# Altium project MP3_Player.PrjPcb
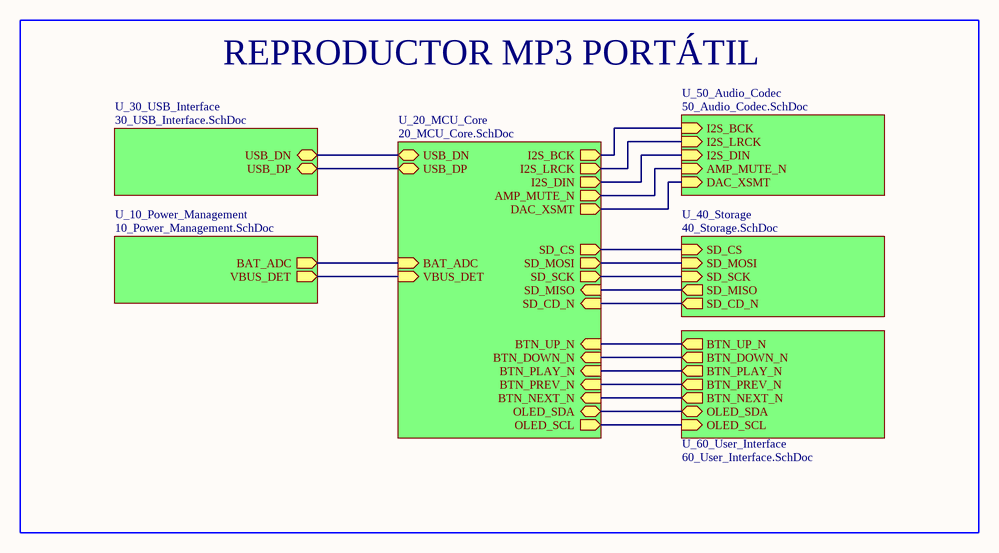
[diagram p0: 00_System_Top.SchDoc]
7 sheets, 93 parts. Net scope: hierarchical (ports join the sheet entries above them; power ports are global).
Board file: MP3_Player.PcbDoc
Sheets:
  00_System_Top.SchDoc
    U_10_Power_Management = 10_Power_Management.SchDoc
    U_60_User_Interface = 60_User_Interface.SchDoc
    U_20_MCU_Core = 20_MCU_Core.SchDoc
    U_30_USB_Interface = 30_USB_Interface.SchDoc
    U_40_Storage = 40_Storage.SchDoc
    U_50_Audio_Codec = 50_Audio_Codec.SchDoc

## Sheet 00_System_Top.SchDoc: Diagrama de bloques
size A4; DrawnBy: Mateo Cárdenas; Revision: Rev A; SheetNumber: 1; SheetTotal: 7

### Sub-sheets
U_10_Power_Management = 10_Power_Management.SchDoc: BAT_ADC (out), VBUS_DET (out)
U_20_MCU_Core = 20_MCU_Core.SchDoc: USB_DN (bidir), USB_DP (bidir), I2S_BCK (out), I2S_LRCK (out), I2S_DIN (out), AMP_MUTE_N (out), DAC_XSMT (out), SD_MOSI (out), SD_SCK (out), SD_MISO (in), SD_CD_N (in), SD_CS (out), OLED_SCL (out), OLED_SDA (bidir), BTN_NEXT_N (in), BTN_PREV_N (in), BTN_PLAY_N (in), BTN_DOWN_N (in), BTN_UP_N (in), VBUS_DET (in), BAT_ADC (in)
U_30_USB_Interface = 30_USB_Interface.SchDoc: USB_DN (bidir), USB_DP (bidir)
U_40_Storage = 40_Storage.SchDoc: SD_CS (in), SD_MOSI (in), SD_SCK (in), SD_MISO (out), SD_CD_N (out)
U_50_Audio_Codec = 50_Audio_Codec.SchDoc: I2S_BCK (in), I2S_LRCK (in), I2S_DIN (in), DAC_XSMT (in), AMP_MUTE_N (in)
U_60_User_Interface = 60_User_Interface.SchDoc: BTN_UP_N (out), BTN_DOWN_N (out), BTN_PLAY_N (out), BTN_PREV_N (out), BTN_NEXT_N (out), OLED_SDA (bidir), OLED_SCL (in)

### Nets
AMP_MUTE_N: sheet U_20_MCU_Core/AMP_MUTE_N, sheet U_50_Audio_Codec/AMP_MUTE_N
BAT_ADC: sheet U_10_Power_Management/BAT_ADC, sheet U_20_MCU_Core/BAT_ADC
BTN_DOWN_N: sheet U_60_User_Interface/BTN_DOWN_N, sheet U_20_MCU_Core/BTN_DOWN_N
BTN_NEXT_N: sheet U_60_User_Interface/BTN_NEXT_N, sheet U_20_MCU_Core/BTN_NEXT_N
BTN_PLAY_N: sheet U_60_User_Interface/BTN_PLAY_N, sheet U_20_MCU_Core/BTN_PLAY_N
BTN_PREV_N: sheet U_60_User_Interface/BTN_PREV_N, sheet U_20_MCU_Core/BTN_PREV_N
BTN_UP_N: sheet U_60_User_Interface/BTN_UP_N, sheet U_20_MCU_Core/BTN_UP_N
DAC_XSMT: sheet U_20_MCU_Core/DAC_XSMT, sheet U_50_Audio_Codec/DAC_XSMT
I2S_BCK: sheet U_20_MCU_Core/I2S_BCK, sheet U_50_Audio_Codec/I2S_BCK
I2S_DIN: sheet U_20_MCU_Core/I2S_DIN, sheet U_50_Audio_Codec/I2S_DIN
I2S_LRCK: sheet U_20_MCU_Core/I2S_LRCK, sheet U_50_Audio_Codec/I2S_LRCK
OLED_SCL: sheet U_60_User_Interface/OLED_SCL, sheet U_20_MCU_Core/OLED_SCL
OLED_SDA: sheet U_60_User_Interface/OLED_SDA, sheet U_20_MCU_Core/OLED_SDA
SD_CD_N: sheet U_20_MCU_Core/SD_CD_N, sheet U_40_Storage/SD_CD_N
SD_CS: sheet U_20_MCU_Core/SD_CS, sheet U_40_Storage/SD_CS
SD_MISO: sheet U_20_MCU_Core/SD_MISO, sheet U_40_Storage/SD_MISO
SD_MOSI: sheet U_20_MCU_Core/SD_MOSI, sheet U_40_Storage/SD_MOSI
SD_SCK: sheet U_20_MCU_Core/SD_SCK, sheet U_40_Storage/SD_SCK
USB_DN: sheet U_20_MCU_Core/USB_DN, sheet U_30_USB_Interface/USB_DN
USB_DP: sheet U_20_MCU_Core/USB_DP, sheet U_30_USB_Interface/USB_DP
VBUS_DET: sheet U_10_Power_Management/VBUS_DET, sheet U_20_MCU_Core/VBUS_DET

### Notes on the sheet
- REPRODUCTOR MP3 PORTÁTIL

## Sheet 10_Power_Management.SchDoc: Gestión de energía
size A4; DrawnBy: Mateo Cárdenas; Revision: Rev A; SheetNumber: 2; SheetTotal: 7
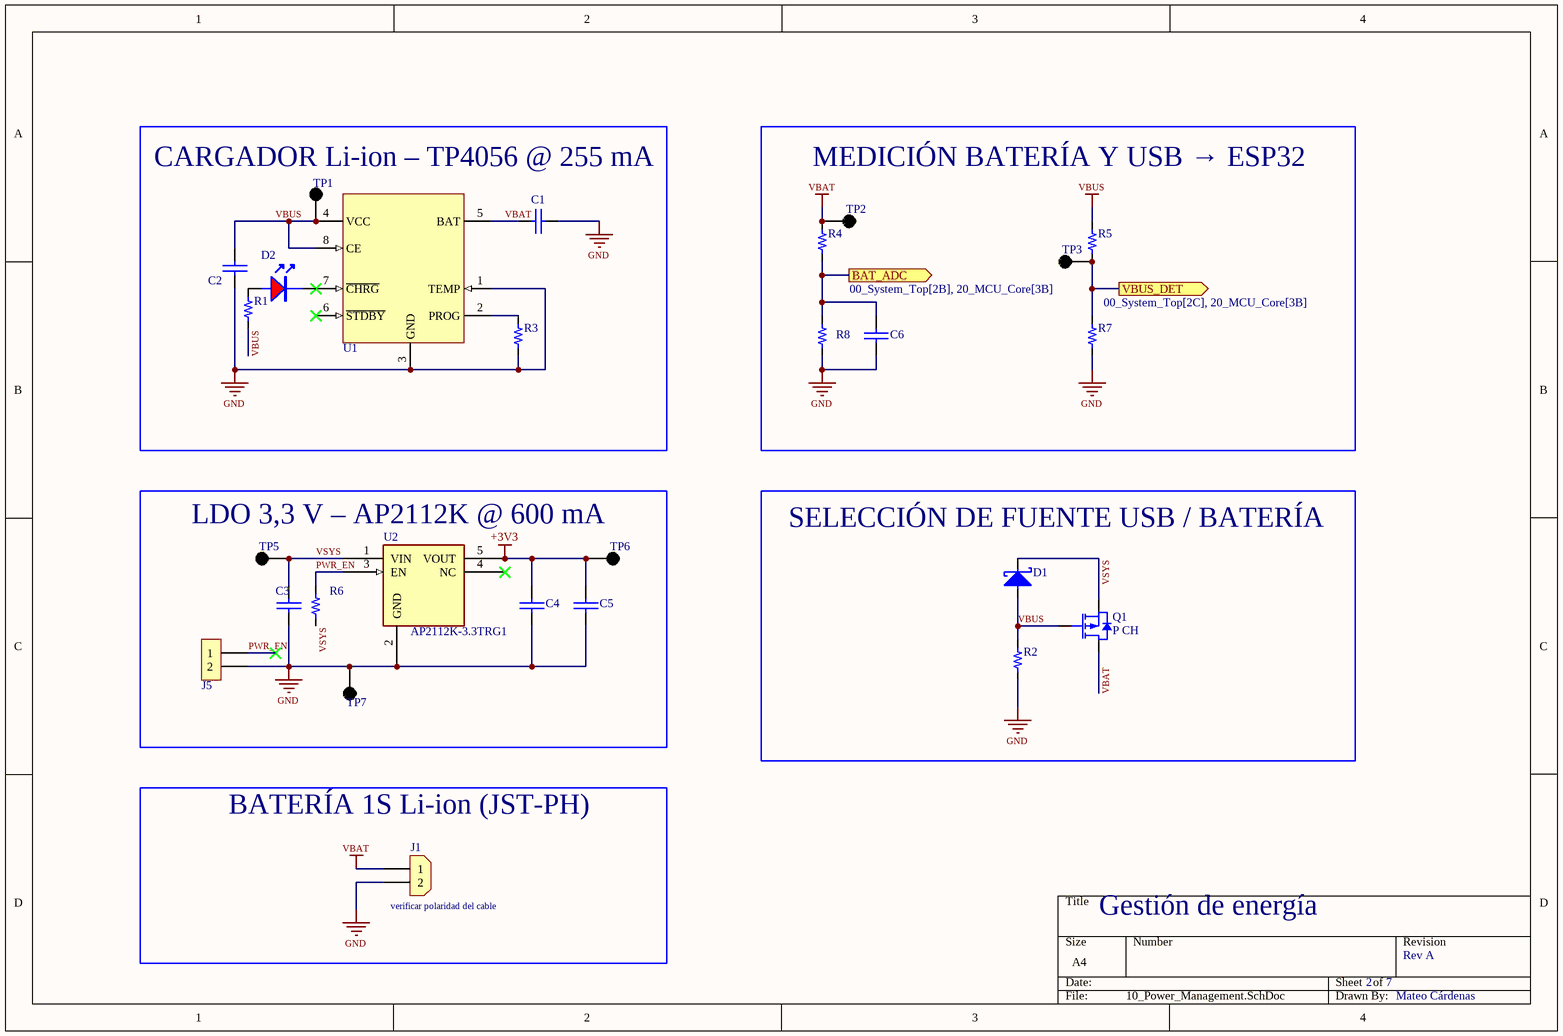
[diagram p1: 10_Power_Management.SchDoc]

### Parts
C1  10uF 10V  [0603_cap]  (value not drawn)
C2  10uF 10V  [0603_cap]  (value not drawn)
C3  10uF 10V  [0603_cap]  (value not drawn)
C4  10uF 10V  [0603_cap]  (value not drawn)
C5  0.1uF 50V  [0603_cap]  (value not drawn)
C6  0.1uF 50V  [0603_cap]  (value not drawn)
D1  40V 1A  [SOD_123]  (value not drawn)
D2  2V  [0805_LED]  (value not drawn)
J1  Connector 2pos  [CON_2x1_TH_2MM]  (value not drawn)
J5  2x1  [H_2x1_TH_100mil]  (value not drawn)  (no BOM)
Q1  P CH  [SOT_23_3]
R1  1k 1/10W  [0603_res]  (value not drawn)
R2  49k9 1/10W  [0603_res]  (value not drawn)
R3  4k7 1/10W  [0603_res]  (value not drawn)
R4  390k 1/10W  [0603_res]  (value not drawn)
R5  390k 1/10W  [0603_res]  (value not drawn)
R6  10k 1/10W  [0603_res]  (value not drawn)
R7  390k 1/10W  [0603_res]  (value not drawn)
R8  390k 1/10W  [0603_res]  (value not drawn)
TP1  Test Point  [Test Point]  (value not drawn)
TP2  Test Point  [Test Point]  (value not drawn)
TP3  Test Point  [Test Point]  (value not drawn)
TP5  Test Point  [Test Point]  (value not drawn)
TP6  Test Point  [Test Point]  (value not drawn)
TP7  Test Point  [Test Point]  (value not drawn)
U1  4.2V 1A  [SOIC_8_3.9mm]  (value not drawn)
U2  AP2112K-3.3TRG1  [SOT-23-5]

### Blocks framed on the sheet
CARGADOR Li-ion – TP4056 @ 255 mA: C1 C2 D2 R1 R3 TP1 U1
MEDICIÓN BATERÍA Y USB → ESP32: C6 R4 R5 R7 R8 TP2 TP3
LDO 3,3 V – AP2112K @ 600 mA: C3-C5 J5 R6 TP5-TP7 U2
SELECCIÓN DE FUENTE USB / BATERÍA: D1 Q1 R2
BATERÍA 1S Li-ion (JST-PH): J1

### Ports
BAT_ADC (out, see 00_System_Top[2B], 20_MCU_Core[3B]), VBUS_DET (out, see 00_System_Top[2C], 20_MCU_Core[3B])

### Nets
+3V3: C4.1 C5.1 TP6.1(TP?) U2.5(VOUT)
GND: C1.1 C2.2 C3.2 C4.2 C5.2 C6.1 J1.2 J5.2 R2.1 R3.1 R7.2 R8.1 TP7.1(TP?) U1.1(TEMP) U1.3(GND) U2.2(GND)
VBAT: C1.2 J1.1 Q1.3(D) R4.2 TP2.1(TP?) U1.5(BAT)
VBUS: C2.1 D1.2 Q1.1(G) R1.2 R2.2 R5.1 TP1.1(TP?) U1.4(VCC) U1.8(CE)
BAT_ADC: C6.2 R4.1 R8.2 ; port BAT_ADC
PWR_EN: J5.1 R6.2 U2.3(EN)
VBUS_DET: R5.2 R7.1 TP3.1(TP?) ; port VBUS_DET
VSYS: C3.1 D1.1 Q1.2(S) R6.1 TP5.1(TP?) U2.1(VIN)
NetD2_1: D2.1(A) R1.1
NetD2_2: D2.2 U1.7(~{CHRG})
NetR3_2: R3.2 U1.2(PROG)

Not connected (* = marked no-connect by the designer): U1 6(~{STDBY})*; U2 4(NC)*

### Notes on the sheet
- (near J1) verificar polaridad del cable

### Library data of the parts
C1-C4 = Cap_10uF_0603_10V: 10V 10uF X5R ±10% 0603 Multilayer Ceramic Capacitors MLCC - SMD/SMT ROHS; Manufacturer: CCTC; Manufacturer Part Number: TCC0603X5R106K100CT; Supplier 1: LCSC; Supplier Part Number 1: C380314; ComponentLink1Description: LCSC; ComponentLink1URL: https://www.lcsc.com/product-detail/Multilayer-Ceramic-Capacitors-MLCC-SMD-SMT_CCTC-TCC0603X5R106K100CT_C380314.html; Value: 10uF
C5 C6 = Cap_0.1uF_0603_50V: 50V 100nF Y5V -20%~+80% 0603 Multilayer Ceramic Capacitors MLCC - SMD/SMT ROHS; Manufacturer: Walsin Tech Corp; Manufacturer Part Number: 0603F104Z500CT; Supplier 1: LCSC; Supplier Part Number 1: C83060; ComponentLink1Description: LCSC; ComponentLink1URL: https://www.lcsc.com/product-detail/Multilayer-Ceramic-Capacitors-MLCC-SMD-SMT_Walsin-Tech-Corp-0603F104Z500CT_C83060.html; Value: 0.1uF
D1 = D_Schottky_40V_1A_SOD_123F: DIODE SCHOTTKY 40V 1A SOD123F; Manufacturer: Shanghai Prisemi Elec; Manufacturer Part Number: PSBD1DF40V1H; Supplier 1: LCSC; Supplier Part Number 1: C110730; ComponentLink1Description: LCSC; ComponentLink1URL: https://www.lcsc.com/product-detail/Switching-Diode_Shanghai-Prisemi-Elec-PSBD1DF40V1H_C110730.html
D2 = LED_0805_RED: LED RED CLEAR 0805 SMD; Manufacturer: XINGLIGHT; Manufacturer Part Number: XL-2012SURC; Supplier 1: LCSC; Supplier Part Number 1: C965812; ComponentLink1Description: LCSC; ComponentLink1URL: https://www.lcsc.com/product-detail/Light-Emitting-Diodes-LED_XINGLIGHT-XL-2012SURC_C965812.html
J1 = Con_2x1_TH_JST_2MM: 2POS 2MM; Manufacturer: JST; Manufacturer Part Number: S2B-PH-K-S(LF)(SN); Supplier 1: LCSC; Supplier Part Number 1: C173752; ComponentLink1Description: Digi-Key; ComponentLink1URL: https://lcsc.com/product-detail/Wire-To-Board-Connector_JST-S2B-PH-K-S-LF-SN_C173752.html
J5 = H_Male_2x1_TH_100mil: ComponentLink1Description: LCSC
Q1 = Q_PFET_30V_3A_SOT23: MOSFET P-CH 20V 3A SOT23; Manufacturer: ALLPOWER(ShenZhen Quan Li Semiconductor); Manufacturer Part Number: AP2301; Supplier 1: LCSC; Supplier Part Number 1: C385296; ComponentLink1Description: LCSC; ComponentLink1URL: https://www.lcsc.com/product-detail/MOSFETs_ALLPOWER-ShenZhen-Quan-Li-Semiconductor-AP2301_C385296.html
R1 = Res_1k_0603_1/10W: RES SMD 1k OHM 5% 1/10W 0603; Manufacturer: FOJAN; Manufacturer Part Number: FRC0603J102 TS; ComponentLink1URL: https://www.lcsc.com/product-detail/Chip-Resistor-Surface-Mount_FOJAN-FRC0603J102-TS_C2907113.html; Supplier 1: LCSC; Supplier Part Number 1: C2907113; ComponentLink1Description: LCSC; Value: 1k
R2 = Res_49k9_0603_1/10W: 100mW Thick Film Resistor 75V ±100ppm/℃ ±1% 49.9kΩ 0603 Chip Resistor - Surface Mount ROHS; Manufacturer: YAGEO; Manufacturer Part Number: RC0603FR-0749K9L; ComponentLink1URL: https://lcsc.com/product-detail/Chip-Resistor-Surface-Mount_YAGEO-RC0603FR-0749K9L_C114624.html; Supplier 1: LCSC; Supplier Part Number 1: C114624; ComponentLink1Description: LCSC; Value: 49k9
R3 = Res_4k7_0603_1/10W: 100mW Thick Film Resistor 75V ±1% 4.7kΩ 0603 Chip Resistor - Surface Mount ROHS; Manufacturer: VO; Manufacturer Part Number: SCR0603F4K7; ComponentLink1URL: https://lcsc.com/product-detail/Chip-Resistor-Surface-Mount_VO-SCR0603F4K7_C3016318.html; Supplier 1: LCSC; Supplier Part Number 1: C3016318; ComponentLink1Description: LCSC; Value: 4k7
R4 R5 R7 R8 = Res_390k_0603_1/10W: 100mW Thick Film Resistor 75V ±100ppm/℃ ±1% 390kΩ 0603 Chip Resistor - Surface Mount ROHS; Manufacturer: YAGEO; Manufacturer Part Number: RC0603FR-07390KL; ComponentLink1URL: https://lcsc.com/product-detail/Chip-Resistor-Surface-Mount_YAGEO-RC0603FR-07390KL_C137735.html; Supplier 1: LCSC; Supplier Part Number 1: C137735; ComponentLink1Description: LCSC; Value: 390k
R6 = Res_10k_0603_1/10W: RES SMD 10k OHM 5% 1/10W 0603; Manufacturer: FOJAN; Manufacturer Part Number: FRC0603J103TS; ComponentLink1URL: https://www.lcsc.com/product-detail/Chip-Resistor-Surface-Mount_FOJAN-FRC0603J103TS_C2930027.html; Supplier 1: LCSC; Supplier Part Number 1: C2930027; ComponentLink1Description: LCSC; Value: 10k
TP1-TP3 TP5-TP7 = Test Point: PC TEST POINT; Manufacturer: KOA Speer Electronics, Inc.; Manufacturer Part Number: RCWCTE
U1 = IC_BAT_CHG_4.2V_1A: -300mV~8V Lithium-ion/Polymer 1 1A ESOP-8 Battery Management ROHS; Manufacturer: YONGYUTAI; Manufacturer Part Number: TP4056; Supplier 1: LCSC; Supplier Part Number 1: C20199357; ComponentLink1Description: LCSC; ComponentLink1URL: https://lcsc.com/product-detail/Battery-Management_YONGYUTAI-TP4056_C20199357.html
U2 = AP2112K-3.3TRG1: Diodes AP2112 600 mA low-dropout 3.3 V regulator, SOT-23-5 (SOT25). EN high = on.; Manufacturer: Diodes Incorporated; Verification: Pinout and land pattern from datasheet; not yet built or tested; Manufacturer Part Number: AP2112K-3.3TRG1; Datasheet: DS39724 Rev. 2-2 (June 2017)

## Sheet 60_User_Interface.SchDoc: Interfaz de usuario
size A4; DrawnBy: Mateo Cárdenas; Revision: Rev A; SheetNumber: 7; SheetTotal: 7
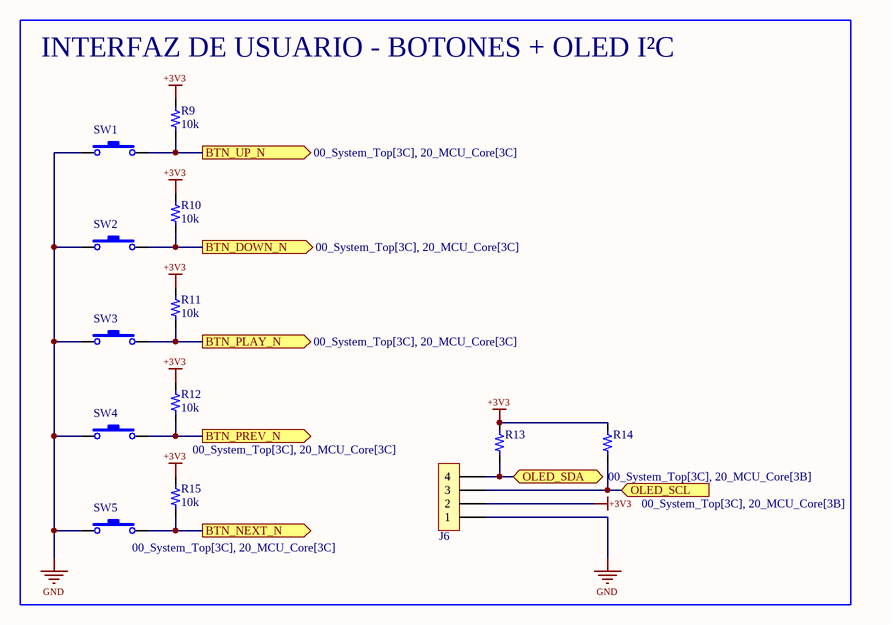
[diagram p2: 60_User_Interface.SchDoc]

### Parts
J6  4x1  [H_4x1_TH_2.54mm]  (value not drawn)  (no BOM)
R9  value 10k  [0603_res]  (hidden comment: 10k 1/10W)
R10  value 10k  [0603_res]  (hidden comment: 10k 1/10W)
R11  value 10k  [0603_res]  (hidden comment: 10k 1/10W)
R12  value 10k  [0603_res]  (hidden comment: 10k 1/10W)
R13  4k7 1/10W  [0603_res]  (value not drawn)
R14  4k7 1/10W  [0603_res]  (value not drawn)
R15  value 10k  [0603_res]  (hidden comment: 10k 1/10W)
SW1  Sw  [Sw_PUSH_4.5x4.5x5mm]  (value not drawn)
SW2  Sw  [Sw_PUSH_4.5x4.5x5mm]  (value not drawn)
SW3  Sw  [Sw_PUSH_4.5x4.5x5mm]  (value not drawn)
SW4  Sw  [Sw_PUSH_4.5x4.5x5mm]  (value not drawn)
SW5  Sw  [Sw_PUSH_4.5x4.5x5mm]  (value not drawn)

### Blocks framed on the sheet
INTERFAZ DE USUARIO - BOTONES + OLED I²C: J6 R9-R15 SW1-SW5

### Ports
BTN_DOWN_N (out, see 00_System_Top[3C], 20_MCU_Core[3C]), BTN_NEXT_N (out, see 00_System_Top[3C], 20_MCU_Core[3C]), BTN_PLAY_N (out, see 00_System_Top[3C], 20_MCU_Core[3C]), BTN_PREV_N (out, see 00_System_Top[3C], 20_MCU_Core[3C]), BTN_UP_N (out, see 00_System_Top[3C], 20_MCU_Core[3C]), OLED_SCL (in, see 00_System_Top[3C], 20_MCU_Core[3B]), OLED_SDA (bidir, see 00_System_Top[3C], 20_MCU_Core[3B])

### Nets
+3V3: J6.2 R9.1 R10.2 R11.2 R12.1 R13.2 R14.2 R15.1
GND: J6.1 SW1.1 SW2.1 SW3.1 SW4.1 SW5.1
BTN_DOWN_N: R10.1 SW2.2 ; port BTN_DOWN_N
BTN_NEXT_N: R15.2 SW5.2 ; port BTN_NEXT_N
BTN_PLAY_N: R11.1 SW3.2 ; port BTN_PLAY_N
BTN_PREV_N: R12.2 SW4.2 ; port BTN_PREV_N
BTN_UP_N: R9.2 SW1.2 ; port BTN_UP_N
OLED_SCL: J6.3 R14.1 ; port OLED_SCL
OLED_SDA: J6.4 R13.1 ; port OLED_SDA

### Library data of the parts
J6 = H_Male_4x1_TH_100mil: ComponentLink1Description: LCSC
R9-R12 R15 = Res_10k_0603_1/10W: as R6 on sheet 10_Power_Management; ComponentLink1URL: https://www.lcsc.com/product-detail/Chip-Resistor-Surface-Mount_FOJAN-FRC0603J103TS_C2930027.html; Supplier 1: LCSC; Supplier Part Number 1: C2930027; ComponentLink1Description: LCSC
R13 R14 = Res_4k7_0603_1/10W: as R3 on sheet 10_Power_Management; ComponentLink1URL: https://lcsc.com/product-detail/Chip-Resistor-Surface-Mount_VO-SCR0603F4K7_C3016318.html; Supplier 1: LCSC; Supplier Part Number 1: C3016318; ComponentLink1Description: LCSC; Value: 4k7
SW1-SW5 = Sw_PUSH_4.5x4.5x5.0xmm: SWITCH TACTILE SPST-NO 0.05A 12V; Manufacturer: BZCN; Manufacturer Part Number: TSC015A05026A; Supplier 1: LCSC; Supplier Part Number 1: C2888509; Last modified by: N-A.Potosi; Last modified date: 20190222; ComponentLink1Description: LCSC; ComponentLink1URL: https://www.lcsc.com/product-detail/Tactile-Switches_BZCN-TSC015A05026A_C2888509.html

## Sheet 20_MCU_Core.SchDoc: Microcontrolador
size A4; DrawnBy: Mateo Cárdenas; Revision: Rev A; SheetNumber: 3; SheetTotal: 7
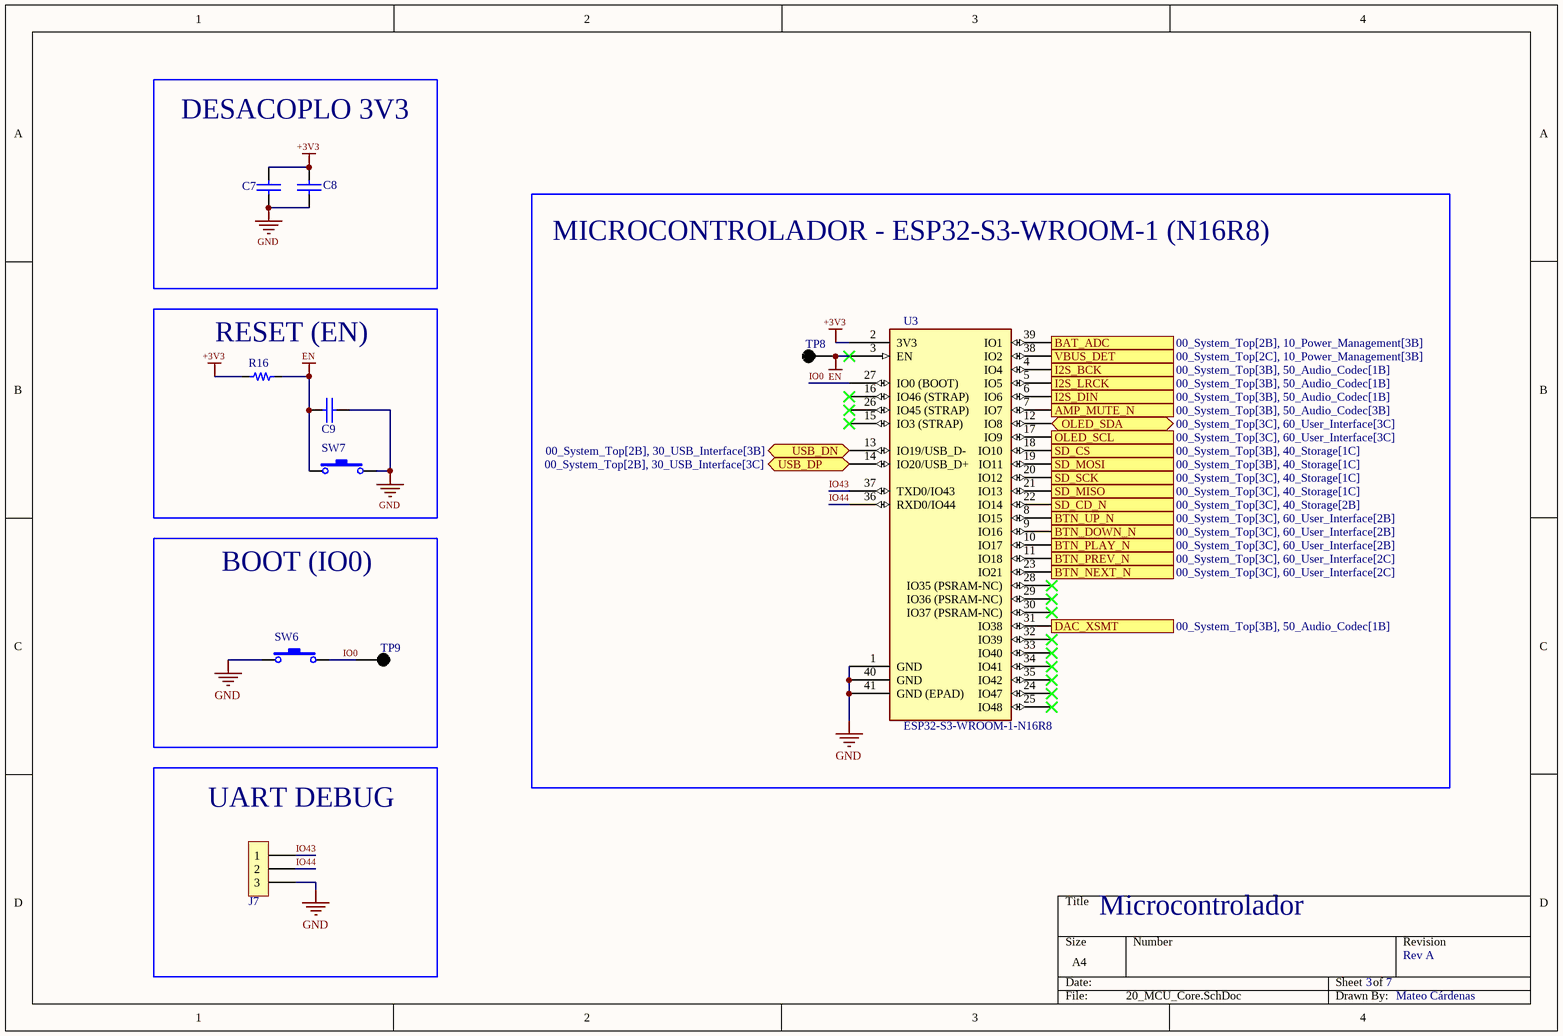
[diagram p3: 20_MCU_Core.SchDoc]

### Parts
C7  0.1uF 50V  [0603_cap]  (value not drawn)
C8  10uF 10V  [0603_cap]  (value not drawn)
C9  1uF 50V  [0603_cap]  (value not drawn)
J7  3x1  [H_3X1_TH_100mil]  (value not drawn)  (no BOM)
R16  10k 1/10W  [0603_res]  (value not drawn)
SW6  Sw  [Sw_PUSH_4.5x4.5x5mm]  (value not drawn)
SW7  Sw  [Sw_PUSH_4.5x4.5x5mm]  (value not drawn)
TP8  Test Point  [Test Point]  (value not drawn)
TP9  Test Point  [Test Point]  (value not drawn)
U3  ESP32-S3-WROOM-1-N16R8  [ESP32-S3-WROOM-1]

### Blocks framed on the sheet
DESACOPLO 3V3: C7 C8
MICROCONTROLADOR - ESP32-S3-WROOM-1 (N16R8): TP8 U3
RESET (EN): C9 R16 SW7
BOOT (IO0): SW6 TP9
UART DEBUG: J7

### Ports
AMP_MUTE_N (out, see 00_System_Top[3B], 50_Audio_Codec[3B]), BAT_ADC (in, see 00_System_Top[2B], 10_Power_Management[3B]), BTN_DOWN_N (in, see 00_System_Top[3C], 60_User_Interface[2B]), BTN_NEXT_N (in, see 00_System_Top[3C], 60_User_Interface[2C]), BTN_PLAY_N (in, see 00_System_Top[3C], 60_User_Interface[2B]), BTN_PREV_N (in, see 00_System_Top[3C], 60_User_Interface[2C]), BTN_UP_N (in, see 00_System_Top[3C], 60_User_Interface[2B]), DAC_XSMT (out, see 00_System_Top[3B], 50_Audio_Codec[1B]), I2S_BCK (out, see 00_System_Top[3B], 50_Audio_Codec[1B]), I2S_DIN (out, see 00_System_Top[3B], 50_Audio_Codec[1B]), I2S_LRCK (out, see 00_System_Top[3B], 50_Audio_Codec[1B]), OLED_SCL (out, see 00_System_Top[3C], 60_User_Interface[3C]), OLED_SDA (bidir, see 00_System_Top[3C], 60_User_Interface[3C]), SD_CD_N (in, see 00_System_Top[3C], 40_Storage[2B]), SD_CS (out, see 00_System_Top[3B], 40_Storage[1C]), SD_MISO (in, see 00_System_Top[3C], 40_Storage[1C]), SD_MOSI (out, see 00_System_Top[3B], 40_Storage[1C]), SD_SCK (out, see 00_System_Top[3C], 40_Storage[1C]), USB_DN (bidir, see 00_System_Top[2B], 30_USB_Interface[3B]), USB_DP (bidir, see 00_System_Top[2B], 30_USB_Interface[3C]), VBUS_DET (in, see 00_System_Top[2C], 10_Power_Management[3B])

### Nets
+3V3: C7.1 C8.1 R16.1 U3.2(3V3)
EN: C9.1 R16.2 SW7.1 TP8.1(TP?) U3.3(EN)
GND: C7.2 C8.2 C9.2 J7.3 SW6.1 SW7.2 U3.1(GND) U3.40(GND) U3.41(GND_(EPAD))
AMP_MUTE_N: U3.7(IO7) ; port AMP_MUTE_N
BAT_ADC: U3.39(IO1) ; port BAT_ADC
BTN_DOWN_N: U3.9(IO16) ; port BTN_DOWN_N
BTN_NEXT_N: U3.23(IO21) ; port BTN_NEXT_N
BTN_PLAY_N: U3.10(IO17) ; port BTN_PLAY_N
BTN_PREV_N: U3.11(IO18) ; port BTN_PREV_N
BTN_UP_N: U3.8(IO15) ; port BTN_UP_N
DAC_XSMT: U3.31(IO38) ; port DAC_XSMT
I2S_BCK: U3.4(IO4) ; port I2S_BCK
I2S_DIN: U3.6(IO6) ; port I2S_DIN
I2S_LRCK: U3.5(IO5) ; port I2S_LRCK
IO0: SW6.2 TP9.1(TP?) U3.27(IO0_(BOOT))
IO43: J7.1 U3.37(TXD0/IO43)
IO44: J7.2 U3.36(RXD0/IO44)
OLED_SCL: U3.17(IO9) ; port OLED_SCL
OLED_SDA: U3.12(IO8) ; port OLED_SDA
SD_CD_N: U3.22(IO14) ; port SD_CD_N
SD_CS: U3.18(IO10) ; port SD_CS
SD_MISO: U3.21(IO13) ; port SD_MISO
SD_MOSI: U3.19(IO11) ; port SD_MOSI
SD_SCK: U3.20(IO12) ; port SD_SCK
USB_DN: U3.13(IO19/USB_D-) ; port USB_DN
USB_DP: U3.14(IO20/USB_D+) ; port USB_DP
VBUS_DET: U3.38(IO2) ; port VBUS_DET

Not connected (* = marked no-connect by the designer): U3 15(IO3_(STRAP))* 16(IO46_(STRAP))* 24(IO47)* 25(IO48)* 26(IO45_(STRAP))* 28(IO35_(PSRAM-NC))* 29(IO36_(PSRAM-NC))* 30(IO37_(PSRAM-NC))* 32(IO39)* 33(IO40)* 34(IO41)* 35(IO42)*

### Library data of the parts
C7 = Cap_0.1uF_0603_50V: as C5 on sheet 10_Power_Management; Supplier 1: LCSC; Supplier Part Number 1: C83060; ComponentLink1Description: LCSC; ComponentLink1URL: https://www.lcsc.com/product-detail/Multilayer-Ceramic-Capacitors-MLCC-SMD-SMT_Walsin-Tech-Corp-0603F104Z500CT_C83060.html; Value: 0.1uF
C8 = Cap_10uF_0603_10V: as C1 on sheet 10_Power_Management; Supplier 1: LCSC; Supplier Part Number 1: C380314; ComponentLink1Description: LCSC; ComponentLink1URL: https://www.lcsc.com/product-detail/Multilayer-Ceramic-Capacitors-MLCC-SMD-SMT_CCTC-TCC0603X5R106K100CT_C380314.html; Value: 10uF
C9 = Cap_1uF_0603_50V: 50V 1uF X5R ±10% 0603 Multilayer Ceramic Capacitors MLCC - SMD/SMT ROHS; Manufacturer: Samsung Electro-Mechanics; Manufacturer Part Number: CL10A105KB8NNNC; Supplier 1: LCSC; Supplier Part Number 1: C15849; ComponentLink1Description: LCSC; ComponentLink1URL: https://www.lcsc.com/product-detail/Multilayer-Ceramic-Capacitors-MLCC-SMD-SMT_Samsung-Electro-Mechanics-CL10A105KB8NNNC_C15849.html; Value: 1uF
J7 = H_Male_3x1_TH_100mil: ComponentLink1Description: LCSC
R16 = Res_10k_0603_1/10W: as R6 on sheet 10_Power_Management; ComponentLink1URL: https://www.lcsc.com/product-detail/Chip-Resistor-Surface-Mount_FOJAN-FRC0603J103TS_C2930027.html; Supplier 1: LCSC; Supplier Part Number 1: C2930027; ComponentLink1Description: LCSC; Value: 10k
SW6 SW7 = Sw_PUSH_4.5x4.5x5.0xmm: as SW1 on sheet 60_User_Interface; Supplier 1: LCSC; Supplier Part Number 1: C2888509; Last modified by: N-A.Potosi; Last modified date: 20190222; ComponentLink1Description: LCSC; ComponentLink1URL: https://www.lcsc.com/product-detail/Tactile-Switches_BZCN-TSC015A05026A_C2888509.html
TP8 TP9 = Test Point: as TP1 on sheet 10_Power_Management
U3 = ESP32-S3-WROOM-1-N16R8: ESP32-S3-WROOM-1 module, 16MB flash, 8MB octal PSRAM. IO35-IO37 are used by the PSRAM: leave unconnected.; Manufacturer: Espressif Systems; Verification: Pinout and land pattern from datasheet; not yet built or tested; Manufacturer Part Number: ESP32-S3-WROOM-1-N16R8; Datasheet: esp32-s3-wroom-1_wroom-1u_datasheet_en.pdf v1.8

## Sheet 30_USB_Interface.SchDoc: Interfaz USB
size A4; DrawnBy: Mateo Cárdenas; Revision: Rev A; SheetNumber: 4; SheetTotal: 7
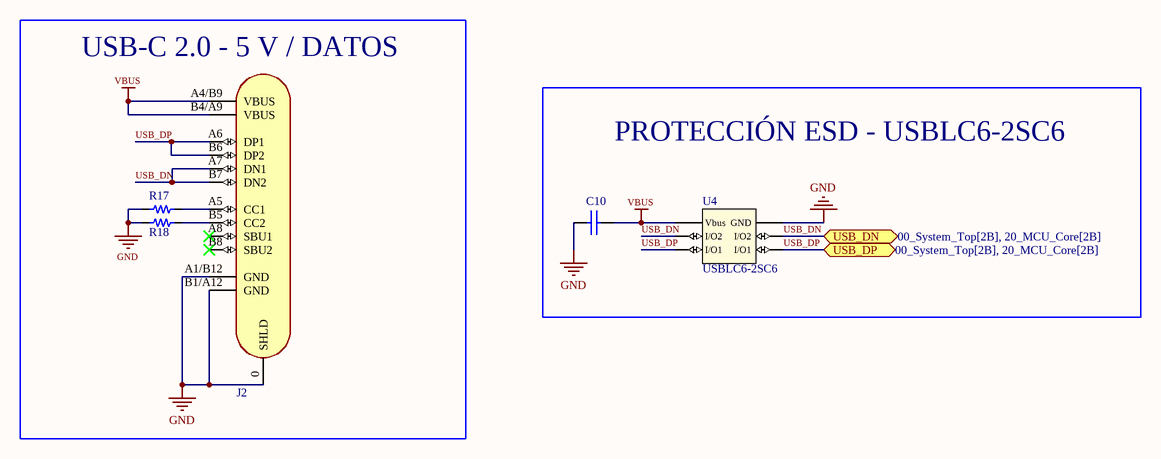
[diagram p4: 30_USB_Interface.SchDoc]

### Parts
C10  0.1uF 50V  [0603_cap]  (value not drawn)
J2  USB C  [CON_USB_C_16P_RA]  (value not drawn)
R17  4k7 1/10W  [0603_res]  (value not drawn)
R18  4k7 1/10W  [0603_res]  (value not drawn)
U4  USBLC6-2SC6  [SOT_23_6]

### Blocks framed on the sheet
USB-C 2.0 - 5 V / DATOS: J2 R17 R18
PROTECCIÓN ESD - USBLC6-2SC6: C10 U4

### Ports
USB_DN (bidir, see 00_System_Top[2B], 20_MCU_Core[2B]), USB_DP (bidir, see 00_System_Top[2B], 20_MCU_Core[2B])

### Nets
GND: C10.2 J2.0(SHLD) J2.A1/B12(GND) J2.B1/A12(GND) R17.1 R18.1 U4.2(GND)
VBUS: C10.1 J2.A4/B9(VBUS) J2.B4/A9(VBUS) U4.5(Vbus)
USB_DN: J2.A7(DN1) J2.B7(DN2) U4.3(I/O2) U4.4(I/O2) ; port USB_DN
USB_DP: J2.A6(DP1) J2.B6(DP2) U4.1(I/O1) U4.6(I/O1) ; port USB_DP
NetJ2_A5: J2.A5(CC1) R17.2
NetJ2_B5: J2.B5(CC2) R18.2

Not connected (* = marked no-connect by the designer): J2 A8(SBU1)* B8(SBU2)*

### Library data of the parts
C10 = Cap_0.1uF_0603_50V: as C5 on sheet 10_Power_Management; Supplier 1: LCSC; Supplier Part Number 1: C83060; ComponentLink1Description: LCSC; ComponentLink1URL: https://www.lcsc.com/product-detail/Multilayer-Ceramic-Capacitors-MLCC-SMD-SMT_Walsin-Tech-Corp-0603F104Z500CT_C83060.html; Value: 0.1uF
J2 = CON_USB_TYPEC_16P: 3A USB 3.1 1 Surface Mount 16P Female -40℃~+85℃ Type-C SMD USB Connectors ROHS; Manufacturer: SHOU HAN; Manufacturer Part Number: TYPE-C-3.1-16PIN; Supplier 1: LCSC; Supplier Part Number 1: C7507405; ComponentLink1Description: LCSC; ComponentLink1URL: https://lcsc.com/product-detail/USB-Connectors_SHOU-HAN-TYPE-C-3-1-16PIN_C7507405.html
R17 R18 = Res_4k7_0603_1/10W: as R3 on sheet 10_Power_Management; ComponentLink1URL: https://lcsc.com/product-detail/Chip-Resistor-Surface-Mount_VO-SCR0603F4K7_C3016318.html; Supplier 1: LCSC; Supplier Part Number 1: C3016318; ComponentLink1Description: LCSC; Value: 4k7
U4 = TVS_5.25V_2CH_SOT_23_6: TVS DIODE 5.25V 17V SOT23-6; Manufacturer: STMicroelectronics; ComponentLink1Description: LCSC; ComponentLink1URL: https://www.lcsc.com/product-detail/ESD-Protection-Devices_STMicroelectronics-USBLC6-2SC6_C7519.html; Supplier 1: LCSC; Manufacturer Part Number: USBLC6-2SC6; Supplier Part Number 1: C7519

## Sheet 40_Storage.SchDoc: Almacenamiento
size A4; DrawnBy: Mateo Cárdenas; Revision: Rev A; SheetNumber: 5; SheetTotal: 7
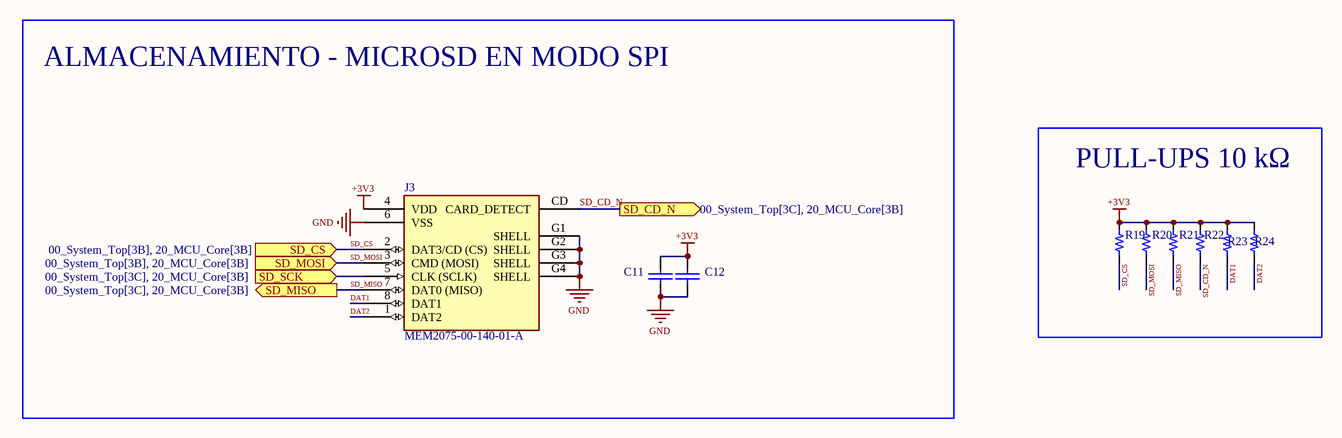
[diagram p5: 40_Storage.SchDoc]

### Parts
C11  0.1uF 50V  [0603_cap]  (value not drawn)
C12  10uF 10V  [0603_cap]  (value not drawn)
J3  MEM2075-00-140-01-A  [MicroSD_GCT_MEM2075-00-140-01-A]
R19  10k 1/10W  [0603_res]  (value not drawn)
R20  10k 1/10W  [0603_res]  (value not drawn)
R21  10k 1/10W  [0603_res]  (value not drawn)
R22  10k 1/10W  [0603_res]  (value not drawn)
R23  10k 1/10W  [0603_res]  (value not drawn)
R24  10k 1/10W  [0603_res]  (value not drawn)

### Blocks framed on the sheet
ALMACENAMIENTO - MICROSD EN MODO SPI: C11 C12 J3
PULL-UPS 10 kΩ: R19-R24

### Ports
SD_CD_N (out, see 00_System_Top[3C], 20_MCU_Core[3B]), SD_CS (in, see 00_System_Top[3B], 20_MCU_Core[3B]), SD_MISO (out, see 00_System_Top[3C], 20_MCU_Core[3B]), SD_MOSI (in, see 00_System_Top[3B], 20_MCU_Core[3B]), SD_SCK (in, see 00_System_Top[3C], 20_MCU_Core[3B])

### Nets
+3V3: C11.1 C12.1 J3.4(VDD) R19.2 R20.2 R21.2 R22.2 R23.1 R24.1
GND: C11.2 C12.2 J3.6(VSS) J3.G1(SHELL) J3.G2(SHELL) J3.G3(SHELL) J3.G4(SHELL)
DAT1: J3.8(DAT1) R23.2
DAT2: J3.1(DAT2) R24.2
SD_CD_N: J3.CD(CARD_DETECT) R22.1 ; port SD_CD_N
SD_CS: J3.2(DAT3/CD_(CS)) R19.1 ; port SD_CS
SD_MISO: J3.7(DAT0_(MISO)) R21.1 ; port SD_MISO
SD_MOSI: J3.3(CMD_(MOSI)) R20.1 ; port SD_MOSI
SD_SCK: J3.5(CLK_(SCLK)) ; port SD_SCK

### Library data of the parts
C11 = Cap_0.1uF_0603_50V: as C5 on sheet 10_Power_Management; Supplier 1: LCSC; Supplier Part Number 1: C83060; ComponentLink1Description: LCSC; ComponentLink1URL: https://www.lcsc.com/product-detail/Multilayer-Ceramic-Capacitors-MLCC-SMD-SMT_Walsin-Tech-Corp-0603F104Z500CT_C83060.html; Value: 0.1uF
C12 = Cap_10uF_0603_10V: as C1 on sheet 10_Power_Management; Supplier 1: LCSC; Supplier Part Number 1: C380314; ComponentLink1Description: LCSC; ComponentLink1URL: https://www.lcsc.com/product-detail/Multilayer-Ceramic-Capacitors-MLCC-SMD-SMT_CCTC-TCC0603X5R106K100CT_C380314.html; Value: 10uF
J3 = MEM2075-00-140-01-A: GCT MEM2075 microSD push-push socket. Normally-open card detect: CD closes to SHELL when a card is inserted.; Verification: Pinout and land pattern from datasheet; not yet built or tested; Manufacturer: GCT; Manufacturer Part Number: MEM2075-00-140-01-A; Datasheet: gct.co/files/drawings/mem2075.pdf rev A1
R19-R24 = Res_10k_0603_1/10W: as R6 on sheet 10_Power_Management; ComponentLink1URL: https://www.lcsc.com/product-detail/Chip-Resistor-Surface-Mount_FOJAN-FRC0603J103TS_C2930027.html; Supplier 1: LCSC; Supplier Part Number 1: C2930027; ComponentLink1Description: LCSC; Value: 10k

## Sheet 50_Audio_Codec.SchDoc: Audio
size A4; DrawnBy: Mateo Cárdenas; Revision: Rev A; SheetNumber: 6; SheetTotal: 7
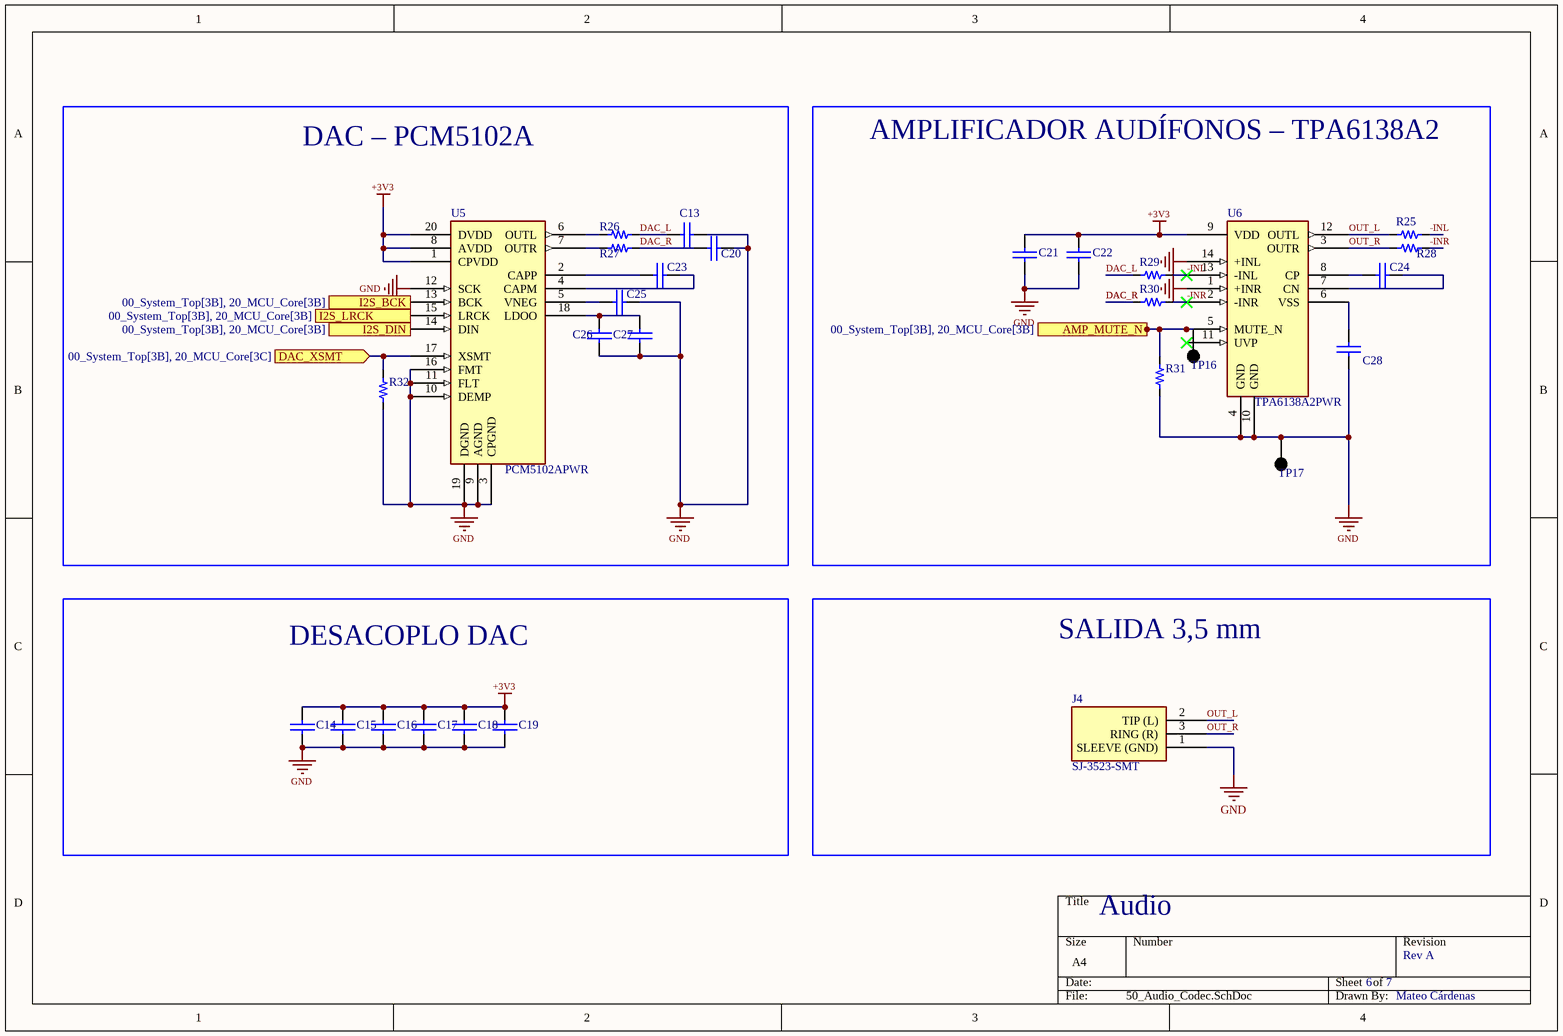
[diagram p6: 50_Audio_Codec.SchDoc]

### Parts
C13  2.2nF  [0603_cap]  (value not drawn)
C14  0.1uF 50V  [0603_cap]  (value not drawn)
C15  10uF 10V  [0603_cap]  (value not drawn)
C16  0.1uF 50V  [0603_cap]  (value not drawn)
C17  10uF 10V  [0603_cap]  (value not drawn)
C18  0.1uF 50V  [0603_cap]  (value not drawn)
C19  10uF 10V  [0603_cap]  (value not drawn)
C20  2.2nF  [0603_cap]  (value not drawn)
C21  0.1uF 50V  [0603_cap]  (value not drawn)
C22  1uF 50V  [0603_cap]  (value not drawn)
C23  2.2uF  [0603_cap]  (value not drawn)
C24  1uF 50V  [0603_cap]  (value not drawn)
C25  2.2uF  [0603_cap]  (value not drawn)
C26  10uF 10V  [0603_cap]  (value not drawn)
C27  0.1uF 50V  [0603_cap]  (value not drawn)
C28  1uF 50V  [0603_cap]  (value not drawn)
J4  SJ-3523-SMT  [Jack_3.5mm_SameSky_SJ-3523-SMT]
R25  10k 1/10W  [0603_res]  (value not drawn)
R26  470R  [0603_res]  (value not drawn)
R27  470R  [0603_res]  (value not drawn)
R28  10k 1/10W  [0603_res]  (value not drawn)
R29  10k 1/10W  [0603_res]  (value not drawn)
R30  10k 1/10W  [0603_res]  (value not drawn)
R31  100k  [0603_res]  (value not drawn)
R32  10k 1/10W  [0603_res]  (value not drawn)
TP16  Test Point  [Test Point]  (value not drawn)
TP17  Test Point  [Test Point]  (value not drawn)
U5  PCM5102APWR  [TSSOP-20_4.4x6.5mm_P0.65mm]
U6  TPA6138A2PWR  [TSSOP-14_4.4x5mm_P0.65mm]

### Blocks framed on the sheet
DAC – PCM5102A: C13 C20 C23 C25-C27 R26 R27 R32 U5
AMPLIFICADOR AUDÍFONOS – TPA6138A2: C21 C22 C24 C28 R25 R28-R31 TP16 TP17 U6
DESACOPLO DAC: C14-C19
SALIDA 3,5 mm: J4

### Ports
AMP_MUTE_N (in, see 00_System_Top[3B], 20_MCU_Core[3B]), DAC_XSMT (in, see 00_System_Top[3B], 20_MCU_Core[3C]), I2S_BCK (in, see 00_System_Top[3B], 20_MCU_Core[3B]), I2S_DIN (in, see 00_System_Top[3B], 20_MCU_Core[3B]), I2S_LRCK (in, see 00_System_Top[3B], 20_MCU_Core[3B])

### Nets
+3V3: C14.1 C15.1 C16.1 C17.1 C18.1 C19.1 C21.1 C22.1 U5.1(CPVDD) U5.8(AVDD) U5.20(DVDD) U6.9(VDD)
GND: C13.2 C14.2 C15.2 C16.2 C17.2 C18.2 C19.2 C20.2 C21.2 C22.2 C25.2 C26.2 C27.2 C28.1 J4.1(SLEEVE_(GND)) R31.1 R32.1 TP17.1(TP?) U5.3(CPGND) U5.9(AGND) U5.10(DEMP) U5.11(FLT) U5.12(SCK) U5.16(FMT) U5.19(DGND) U6.1(+INR) U6.4(GND) U6.10(GND) U6.14(+INL)
-INL: R25.2 R29.2 U6.13(-INL)
-INR: R28.2 R30.2 U6.2(-INR)
AMP_MUTE_N: R31.2 TP16.1(TP?) U6.5(MUTE_N) ; port AMP_MUTE_N
DAC_L: C13.1 R26.2 R29.1
DAC_R: C20.1 R27.2 R30.1
DAC_XSMT: R32.2 U5.17(XSMT) ; port DAC_XSMT
I2S_BCK: U5.13(BCK) ; port I2S_BCK
I2S_DIN: U5.14(DIN) ; port I2S_DIN
I2S_LRCK: U5.15(LRCK) ; port I2S_LRCK
OUT_L: J4.2(TIP_(L)) R25.1 U6.12(OUTL)
OUT_R: J4.3(RING_(R)) R28.1 U6.3(OUTR)
NetC23_1: C23.1 U5.2(CAPP)
NetC23_2: C23.2 U5.4(CAPM)
NetC24_1: C24.1 U6.8(CP)
NetC24_2: C24.2 U6.7(CN)
NetC25_1: C25.1 U5.5(VNEG)
NetC26_1: C26.1 C27.1 U5.18(LDOO)
NetC28_2: C28.2 U6.6(VSS)
NetR26_1: R26.1 U5.6(OUTL)
NetR27_1: R27.1 U5.7(OUTR)

Not connected (* = marked no-connect by the designer): U6 11(UVP)*

### Library data of the parts
C13 C20 = Cap_2.2nF_0603_50V: CAP CER 2.2 nF 50V X7R 0603; Manufacturer: TBD; Manufacturer Part Number: TBD; Supplier 1: TBD; Supplier Part Number 1: TBD; ComponentLink1Description: TBD; ComponentLink1URL: TBD; Value: 2.2nF
C14 C16 C18 C21 C27 = Cap_0.1uF_0603_50V: as C5 on sheet 10_Power_Management; Supplier 1: LCSC; Supplier Part Number 1: C83060; ComponentLink1Description: LCSC; ComponentLink1URL: https://www.lcsc.com/product-detail/Multilayer-Ceramic-Capacitors-MLCC-SMD-SMT_Walsin-Tech-Corp-0603F104Z500CT_C83060.html; Value: 0.1uF
C15 C17 C19 C26 = Cap_10uF_0603_10V: as C1 on sheet 10_Power_Management; Supplier 1: LCSC; Supplier Part Number 1: C380314; ComponentLink1Description: LCSC; ComponentLink1URL: https://www.lcsc.com/product-detail/Multilayer-Ceramic-Capacitors-MLCC-SMD-SMT_CCTC-TCC0603X5R106K100CT_C380314.html; Value: 10uF
C22 C24 C28 = Cap_1uF_0603_50V: as C9 on sheet 20_MCU_Core; Supplier 1: LCSC; Supplier Part Number 1: C15849; ComponentLink1Description: LCSC; ComponentLink1URL: https://www.lcsc.com/product-detail/Multilayer-Ceramic-Capacitors-MLCC-SMD-SMT_Samsung-Electro-Mechanics-CL10A105KB8NNNC_C15849.html; Value: 1uF
C23 C25 = Cap_2.2uF_0603_10V: CAP CER 2.2 µF 10V X5R 0603; Manufacturer: TBD; Manufacturer Part Number: TBD; Supplier 1: TBD; Supplier Part Number 1: TBD; ComponentLink1Description: TBD; ComponentLink1URL: TBD; Value: 2.2uF
J4 = SJ-3523-SMT: Same Sky 3.5 mm stereo jack, SMT, no switch. 1 = sleeve, 2 = tip, 3 = ring.; Manufacturer: Same Sky (CUI Devices); Manufacturer Part Number: SJ-3523-SMT-TR; Verification: Pinout and land pattern from datasheet; not yet built or tested; Datasheet: sj-352x-smt.pdf dated 04/15/2025
R25 R28-R30 R32 = Res_10k_0603_1/10W: as R6 on sheet 10_Power_Management; ComponentLink1URL: https://www.lcsc.com/product-detail/Chip-Resistor-Surface-Mount_FOJAN-FRC0603J103TS_C2930027.html; Supplier 1: LCSC; Supplier Part Number 1: C2930027; ComponentLink1Description: LCSC; Value: 10k
R26 R27 = Res_470R_0603_1/10W: RES 470 Ω 1% 1/10W 0603; Manufacturer: TBD; ComponentLink1URL: TBD; Manufacturer Part Number: TBD; Supplier 1: TBD; Supplier Part Number 1: TBD; ComponentLink1Description: TBD; Value: 470R
R31 = Res_100k_0603_1/10W: RES 100 kΩ 1% 1/10W 0603; Manufacturer: TBD; ComponentLink1URL: TBD; Manufacturer Part Number: TBD; Supplier 1: TBD; Supplier Part Number 1: TBD; ComponentLink1Description: TBD; Value: 100k
TP16 TP17 = Test Point: as TP1 on sheet 10_Power_Management
U5 = PCM5102APWR: TI PCM5102A 32-bit 384 kHz I2S stereo DAC, 2.1 Vrms ground-centred line output, TSSOP-20. Hardware control only (no I2C).; Manufacturer: Texas Instruments; Verification: Pinout and land pattern from datasheet; not yet built or tested; Manufacturer Part Number: PCM5102APWR; Datasheet: SLAS859C (May 2015)
U6 = TPA6138A2PWR: TI TPA6138A2 25 mW DirectPath ground-centred stereo headphone amp with adjustable gain, TSSOP-14. No output coupling capacitors needed.; Manufacturer: Texas Instruments; Verification: Pinout and land pattern from datasheet; not yet built or tested; Manufacturer Part Number: TPA6138A2PWR; Datasheet: SLOS704B (Aug 2015)

## Nets that join several sheets
+3V3: 10_Power_Management (C4.1 C5.1 TP6.1 U2.5), 60_User_Interface (8 pins), 20_MCU_Core (C7.1 C8.1 R16.1 U3.2), 40_Storage (9 pins), 50_Audio_Codec (12 pins)
GND: 10_Power_Management (16 pins), 60_User_Interface (6 pins), 20_MCU_Core (9 pins), 30_USB_Interface (7 pins), 40_Storage (7 pins), 50_Audio_Codec (29 pins)
VBUS: 10_Power_Management (9 pins), 30_USB_Interface (C10.1 J2.A4/B9 J2.B4/A9 U4.5)
AMP_MUTE_N: 20_MCU_Core (U3.7), 50_Audio_Codec (R31.2 TP16.1 U6.5)
BAT_ADC: 10_Power_Management (C6.2 R4.1 R8.2), 20_MCU_Core (U3.39)
BTN_DOWN_N: 60_User_Interface (R10.1 SW2.2), 20_MCU_Core (U3.9)
BTN_NEXT_N: 60_User_Interface (R15.2 SW5.2), 20_MCU_Core (U3.23)
BTN_PLAY_N: 60_User_Interface (R11.1 SW3.2), 20_MCU_Core (U3.10)
BTN_PREV_N: 60_User_Interface (R12.2 SW4.2), 20_MCU_Core (U3.11)
BTN_UP_N: 60_User_Interface (R9.2 SW1.2), 20_MCU_Core (U3.8)
DAC_XSMT: 20_MCU_Core (U3.31), 50_Audio_Codec (R32.2 U5.17)
I2S_BCK: 20_MCU_Core (U3.4), 50_Audio_Codec (U5.13)
I2S_DIN: 20_MCU_Core (U3.6), 50_Audio_Codec (U5.14)
I2S_LRCK: 20_MCU_Core (U3.5), 50_Audio_Codec (U5.15)
OLED_SCL: 60_User_Interface (J6.3 R14.1), 20_MCU_Core (U3.17)
OLED_SDA: 60_User_Interface (J6.4 R13.1), 20_MCU_Core (U3.12)
SD_CD_N: 20_MCU_Core (U3.22), 40_Storage (J3.CD R22.1)
SD_CS: 20_MCU_Core (U3.18), 40_Storage (J3.2 R19.1)
SD_MISO: 20_MCU_Core (U3.21), 40_Storage (J3.7 R21.1)
SD_MOSI: 20_MCU_Core (U3.19), 40_Storage (J3.3 R20.1)
SD_SCK: 20_MCU_Core (U3.20), 40_Storage (J3.5)
USB_DN: 20_MCU_Core (U3.13), 30_USB_Interface (J2.A7 J2.B7 U4.3 U4.4)
USB_DP: 20_MCU_Core (U3.14), 30_USB_Interface (J2.A6 J2.B6 U4.1 U4.6)
VBUS_DET: 10_Power_Management (R5.2 R7.1 TP3.1), 20_MCU_Core (U3.38)